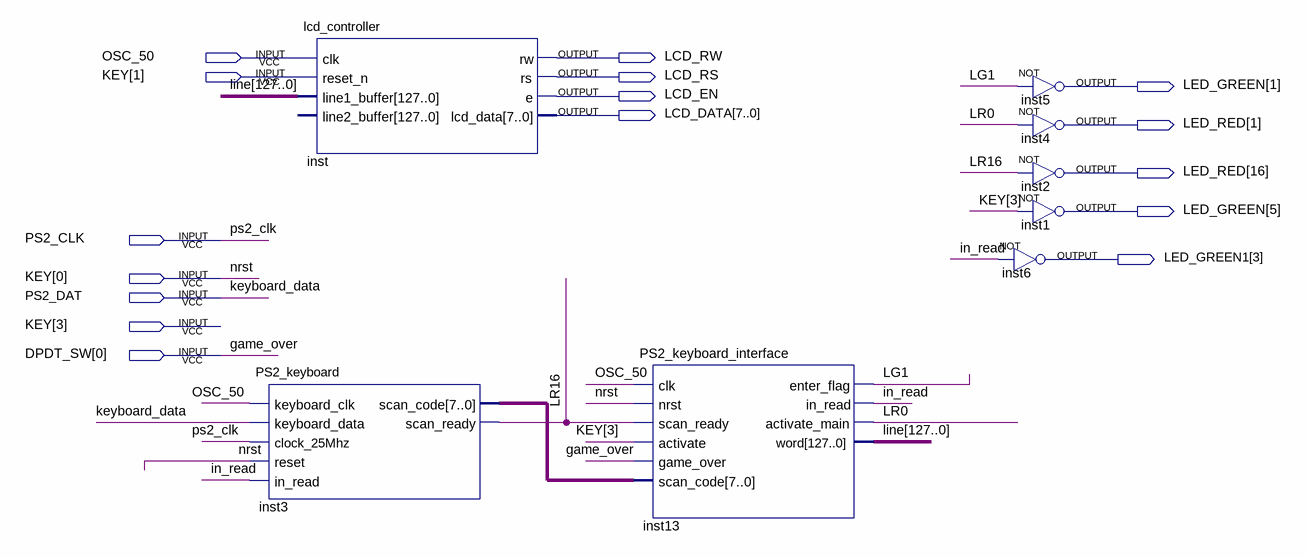
[diagram p0: schematic sheet]
// Quartus schematic lcd_controller_test.bdf as structural Verilog: 8 symbols, 16 pins
module lcd_controller_test (
  input  OSC_50,
  input  [3:0] KEY,
  input  PS2_CLK,
  input  PS2_DAT,
  input  [0:0] DPDT_SW,
  output LCD_RW,
  output LCD_RS,
  output [5:1] LED_GREEN,
  output LCD_EN,
  output [7:0] LCD_DATA,
  output [16:1] LED_RED,
  output [3:3] LED_GREEN1
);

  wire in_read, LG1, LR0, LR16;
  wire [7:0] inst3_scan_code;
  wire [127:0] line;

  PS2_keyboard inst3 (
    .keyboard_clk(OSC_50), .keyboard_data(PS2_DAT), .clock_25Mhz(PS2_CLK), .reset(KEY[0]), .in_read(in_read),
    .scan_code(inst3_scan_code), .scan_ready(LR16));
  lcd_controller inst (
    .clk(OSC_50), .reset_n(KEY[1]), .line1_buffer(line), .rw(LCD_RW), .rs(LCD_RS), .e(LCD_EN),
    .lcd_data(LCD_DATA));  // open: line2_buffer
  PS2_keyboard_interface inst13 (
    .clk(OSC_50), .nrst(KEY[0]), .scan_ready(LR16), .activate(KEY[3]), .game_over(DPDT_SW[0]),
    .scan_code(inst3_scan_code), .enter_flag(LG1), .in_read(in_read), .activate_main(LR0), .word(line));
  not inst5 (LED_GREEN[1], LG1);
  not inst4 (LED_RED[1], LR0);
  not inst2 (LED_RED[16], LR16);
  not inst1 (LED_GREEN[5], KEY[3]);
  not inst6 (LED_GREEN1[3], in_read);

  // Other names for the same wires on the sheet: game_over = DPDT_SW[0]; keyboard_data = PS2_DAT; nrst = KEY[0]
endmodule
